# Altium schematic sheet 20_MCU_Core.SchDoc: Microcontrolador
size A4; DrawnBy: Mateo Cárdenas; Revision: Rev A; SheetNumber: 3; SheetTotal: 7
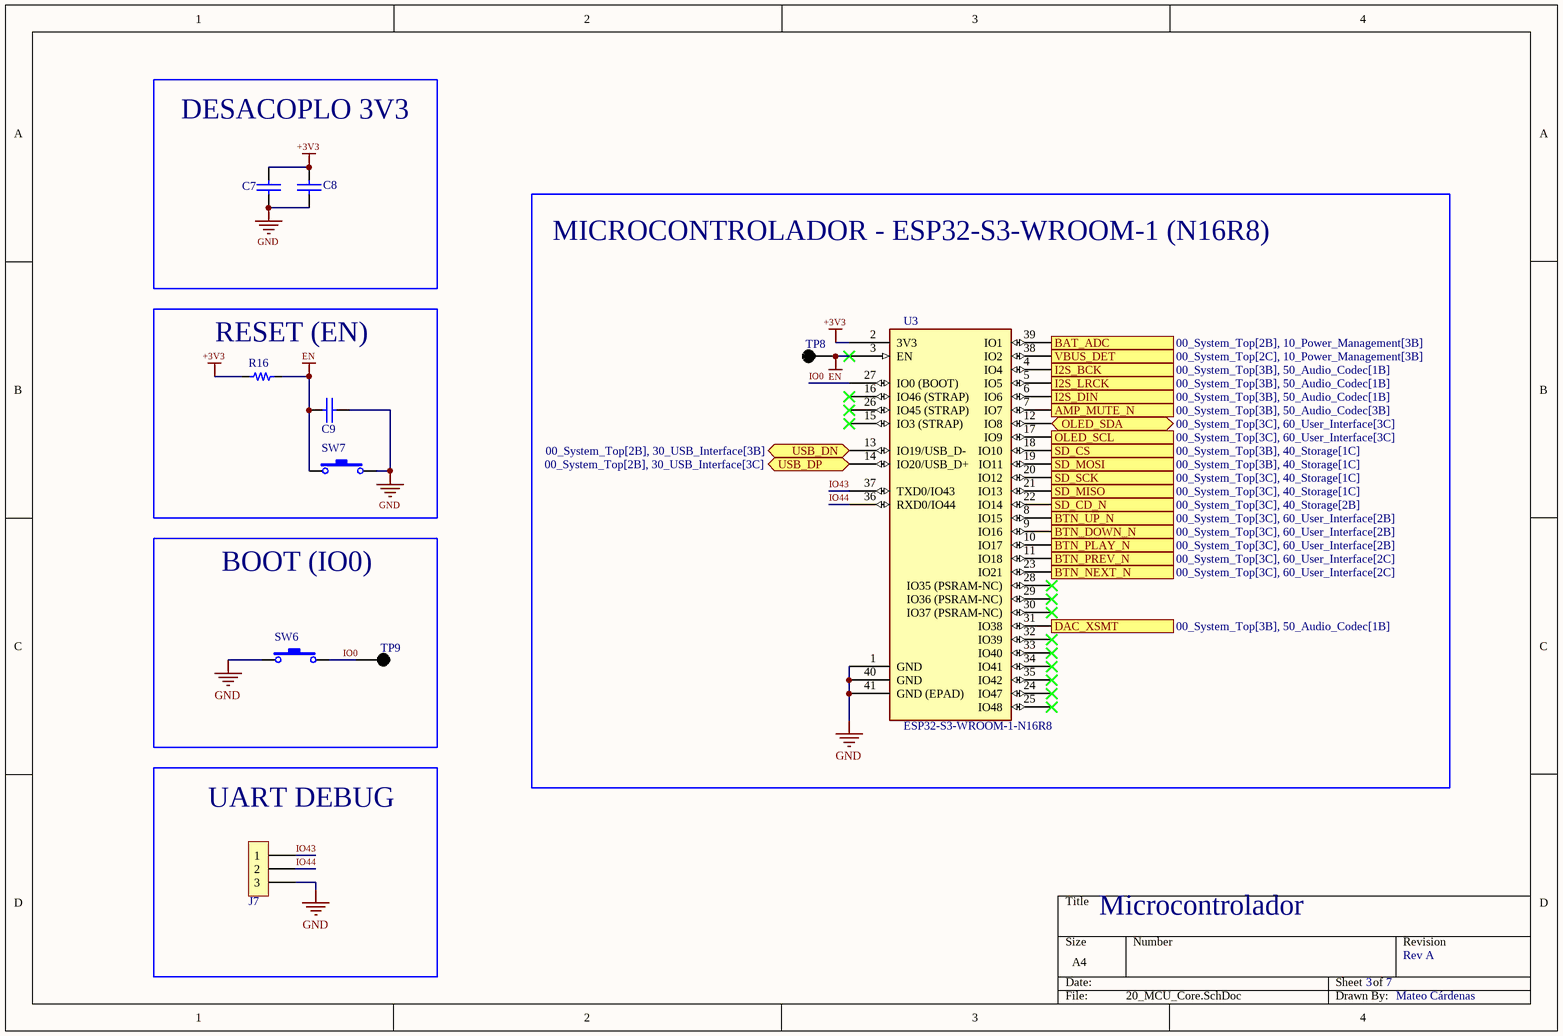
[diagram p0: 20_MCU_Core.SchDoc]

## Parts
C7  0.1uF 50V  [0603_cap]  (value not drawn)
C8  10uF 10V  [0603_cap]  (value not drawn)
C9  1uF 50V  [0603_cap]  (value not drawn)
J7  3x1  [H_3X1_TH_100mil]  (value not drawn)  (no BOM)
R16  10k 1/10W  [0603_res]  (value not drawn)
SW6  Sw  [Sw_PUSH_4.5x4.5x5mm]  (value not drawn)
SW7  Sw  [Sw_PUSH_4.5x4.5x5mm]  (value not drawn)
TP8  Test Point  [Test Point]  (value not drawn)
TP9  Test Point  [Test Point]  (value not drawn)
U3  ESP32-S3-WROOM-1-N16R8  [ESP32-S3-WROOM-1]

## Blocks framed on the sheet
DESACOPLO 3V3: C7 C8
MICROCONTROLADOR - ESP32-S3-WROOM-1 (N16R8): TP8 U3
RESET (EN): C9 R16 SW7
BOOT (IO0): SW6 TP9
UART DEBUG: J7

## Ports
AMP_MUTE_N (out, see 00_System_Top[3B], 50_Audio_Codec[3B]), BAT_ADC (in, see 00_System_Top[2B], 10_Power_Management[3B]), BTN_DOWN_N (in, see 00_System_Top[3C], 60_User_Interface[2B]), BTN_NEXT_N (in, see 00_System_Top[3C], 60_User_Interface[2C]), BTN_PLAY_N (in, see 00_System_Top[3C], 60_User_Interface[2B]), BTN_PREV_N (in, see 00_System_Top[3C], 60_User_Interface[2C]), BTN_UP_N (in, see 00_System_Top[3C], 60_User_Interface[2B]), DAC_XSMT (out, see 00_System_Top[3B], 50_Audio_Codec[1B]), I2S_BCK (out, see 00_System_Top[3B], 50_Audio_Codec[1B]), I2S_DIN (out, see 00_System_Top[3B], 50_Audio_Codec[1B]), I2S_LRCK (out, see 00_System_Top[3B], 50_Audio_Codec[1B]), OLED_SCL (out, see 00_System_Top[3C], 60_User_Interface[3C]), OLED_SDA (bidir, see 00_System_Top[3C], 60_User_Interface[3C]), SD_CD_N (in, see 00_System_Top[3C], 40_Storage[2B]), SD_CS (out, see 00_System_Top[3B], 40_Storage[1C]), SD_MISO (in, see 00_System_Top[3C], 40_Storage[1C]), SD_MOSI (out, see 00_System_Top[3B], 40_Storage[1C]), SD_SCK (out, see 00_System_Top[3C], 40_Storage[1C]), USB_DN (bidir, see 00_System_Top[2B], 30_USB_Interface[3B]), USB_DP (bidir, see 00_System_Top[2B], 30_USB_Interface[3C]), VBUS_DET (in, see 00_System_Top[2C], 10_Power_Management[3B])

## Nets
+3V3: C7.1 C8.1 R16.1 U3.2(3V3)
EN: C9.1 R16.2 SW7.1 TP8.1(TP?) U3.3(EN)
GND: C7.2 C8.2 C9.2 J7.3 SW6.1 SW7.2 U3.1(GND) U3.40(GND) U3.41(GND_(EPAD))
AMP_MUTE_N: U3.7(IO7) ; port AMP_MUTE_N
BAT_ADC: U3.39(IO1) ; port BAT_ADC
BTN_DOWN_N: U3.9(IO16) ; port BTN_DOWN_N
BTN_NEXT_N: U3.23(IO21) ; port BTN_NEXT_N
BTN_PLAY_N: U3.10(IO17) ; port BTN_PLAY_N
BTN_PREV_N: U3.11(IO18) ; port BTN_PREV_N
BTN_UP_N: U3.8(IO15) ; port BTN_UP_N
DAC_XSMT: U3.31(IO38) ; port DAC_XSMT
I2S_BCK: U3.4(IO4) ; port I2S_BCK
I2S_DIN: U3.6(IO6) ; port I2S_DIN
I2S_LRCK: U3.5(IO5) ; port I2S_LRCK
IO0: SW6.2 TP9.1(TP?) U3.27(IO0_(BOOT))
IO43: J7.1 U3.37(TXD0/IO43)
IO44: J7.2 U3.36(RXD0/IO44)
OLED_SCL: U3.17(IO9) ; port OLED_SCL
OLED_SDA: U3.12(IO8) ; port OLED_SDA
SD_CD_N: U3.22(IO14) ; port SD_CD_N
SD_CS: U3.18(IO10) ; port SD_CS
SD_MISO: U3.21(IO13) ; port SD_MISO
SD_MOSI: U3.19(IO11) ; port SD_MOSI
SD_SCK: U3.20(IO12) ; port SD_SCK
USB_DN: U3.13(IO19/USB_D-) ; port USB_DN
USB_DP: U3.14(IO20/USB_D+) ; port USB_DP
VBUS_DET: U3.38(IO2) ; port VBUS_DET

Not connected (* = marked no-connect by the designer): U3 15(IO3_(STRAP))* 16(IO46_(STRAP))* 24(IO47)* 25(IO48)* 26(IO45_(STRAP))* 28(IO35_(PSRAM-NC))* 29(IO36_(PSRAM-NC))* 30(IO37_(PSRAM-NC))* 32(IO39)* 33(IO40)* 34(IO41)* 35(IO42)*

## Library data of the parts
C7 = Cap_0.1uF_0603_50V: 50V 100nF Y5V -20%~+80% 0603 Multilayer Ceramic Capacitors MLCC - SMD/SMT ROHS; Manufacturer: Walsin Tech Corp; Manufacturer Part Number: 0603F104Z500CT; Supplier 1: LCSC; Supplier Part Number 1: C83060; ComponentLink1Description: LCSC; ComponentLink1URL: https://www.lcsc.com/product-detail/Multilayer-Ceramic-Capacitors-MLCC-SMD-SMT_Walsin-Tech-Corp-0603F104Z500CT_C83060.html; Value: 0.1uF
C8 = Cap_10uF_0603_10V: 10V 10uF X5R ±10% 0603 Multilayer Ceramic Capacitors MLCC - SMD/SMT ROHS; Manufacturer: CCTC; Manufacturer Part Number: TCC0603X5R106K100CT; Supplier 1: LCSC; Supplier Part Number 1: C380314; ComponentLink1Description: LCSC; ComponentLink1URL: https://www.lcsc.com/product-detail/Multilayer-Ceramic-Capacitors-MLCC-SMD-SMT_CCTC-TCC0603X5R106K100CT_C380314.html; Value: 10uF
C9 = Cap_1uF_0603_50V: 50V 1uF X5R ±10% 0603 Multilayer Ceramic Capacitors MLCC - SMD/SMT ROHS; Manufacturer: Samsung Electro-Mechanics; Manufacturer Part Number: CL10A105KB8NNNC; Supplier 1: LCSC; Supplier Part Number 1: C15849; ComponentLink1Description: LCSC; ComponentLink1URL: https://www.lcsc.com/product-detail/Multilayer-Ceramic-Capacitors-MLCC-SMD-SMT_Samsung-Electro-Mechanics-CL10A105KB8NNNC_C15849.html; Value: 1uF
J7 = H_Male_3x1_TH_100mil: ComponentLink1Description: LCSC
R16 = Res_10k_0603_1/10W: RES SMD 10k OHM 5% 1/10W 0603; Manufacturer: FOJAN; Manufacturer Part Number: FRC0603J103TS; ComponentLink1URL: https://www.lcsc.com/product-detail/Chip-Resistor-Surface-Mount_FOJAN-FRC0603J103TS_C2930027.html; Supplier 1: LCSC; Supplier Part Number 1: C2930027; ComponentLink1Description: LCSC; Value: 10k
SW6 SW7 = Sw_PUSH_4.5x4.5x5.0xmm: SWITCH TACTILE SPST-NO 0.05A 12V; Manufacturer: BZCN; Manufacturer Part Number: TSC015A05026A; Supplier 1: LCSC; Supplier Part Number 1: C2888509; Last modified by: N-A.Potosi; Last modified date: 20190222; ComponentLink1Description: LCSC; ComponentLink1URL: https://www.lcsc.com/product-detail/Tactile-Switches_BZCN-TSC015A05026A_C2888509.html
TP8 TP9 = Test Point: PC TEST POINT; Manufacturer: KOA Speer Electronics, Inc.; Manufacturer Part Number: RCWCTE
U3 = ESP32-S3-WROOM-1-N16R8: ESP32-S3-WROOM-1 module, 16MB flash, 8MB octal PSRAM. IO35-IO37 are used by the PSRAM: leave unconnected.; Manufacturer: Espressif Systems; Verification: Pinout and land pattern from datasheet; not yet built or tested; Manufacturer Part Number: ESP32-S3-WROOM-1-N16R8; Datasheet: esp32-s3-wroom-1_wroom-1u_datasheet_en.pdf v1.8